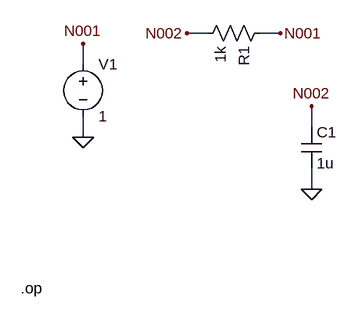
[diagram p0: schematic rc_lowpass.asc]
rc_lowpass.asc, the LTspice schematic file:
Version 4
SHEET 1 880 680
WIRE 160 256 160 288
WIRE 512 336 512 368
WIRE 160 176 160 144
WIRE 432 128 464 128
WIRE 352 128 320 128
WIRE 512 272 512 240
FLAG 160 288 0
FLAG 512 368 0
FLAG 160 144 N001
FLAG 464 128 N001
FLAG 320 128 N002
FLAG 512 240 N002
SYMBOL voltage 160 160 R0
SYMATTR InstName V1
SYMATTR Value 1
SYMBOL res 448 112 R90
SYMATTR InstName R1
SYMATTR Value 1k
SYMBOL cap 496 272 R0
SYMATTR InstName C1
SYMATTR Value 1u
TEXT 64 520 Left 2 !.op

The netlist it stands for:
* rc_lowpass.asc
V1 N001 0 1
R1 N001 N002 1k
C1 N002 0 1u
.op
.backanno
.end